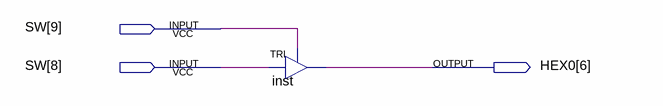
[diagram p0: schematic sheet]
// Quartus schematic test_tri.bdf as structural Verilog: 1 symbols, 3 pins
module test_tri (
  input  [9:8] SW,
  output [6:6] HEX0
);

  TRI inst (.IN(SW[8]), .OE(SW[9]), .OUT(HEX0[6]));
endmodule
